# Altium schematic sheet MONO65_A2_s02 [Block diagram].SchDoc
size A3; DocumentNumber: 2; SheetNumber: 2; SheetTotal: 7
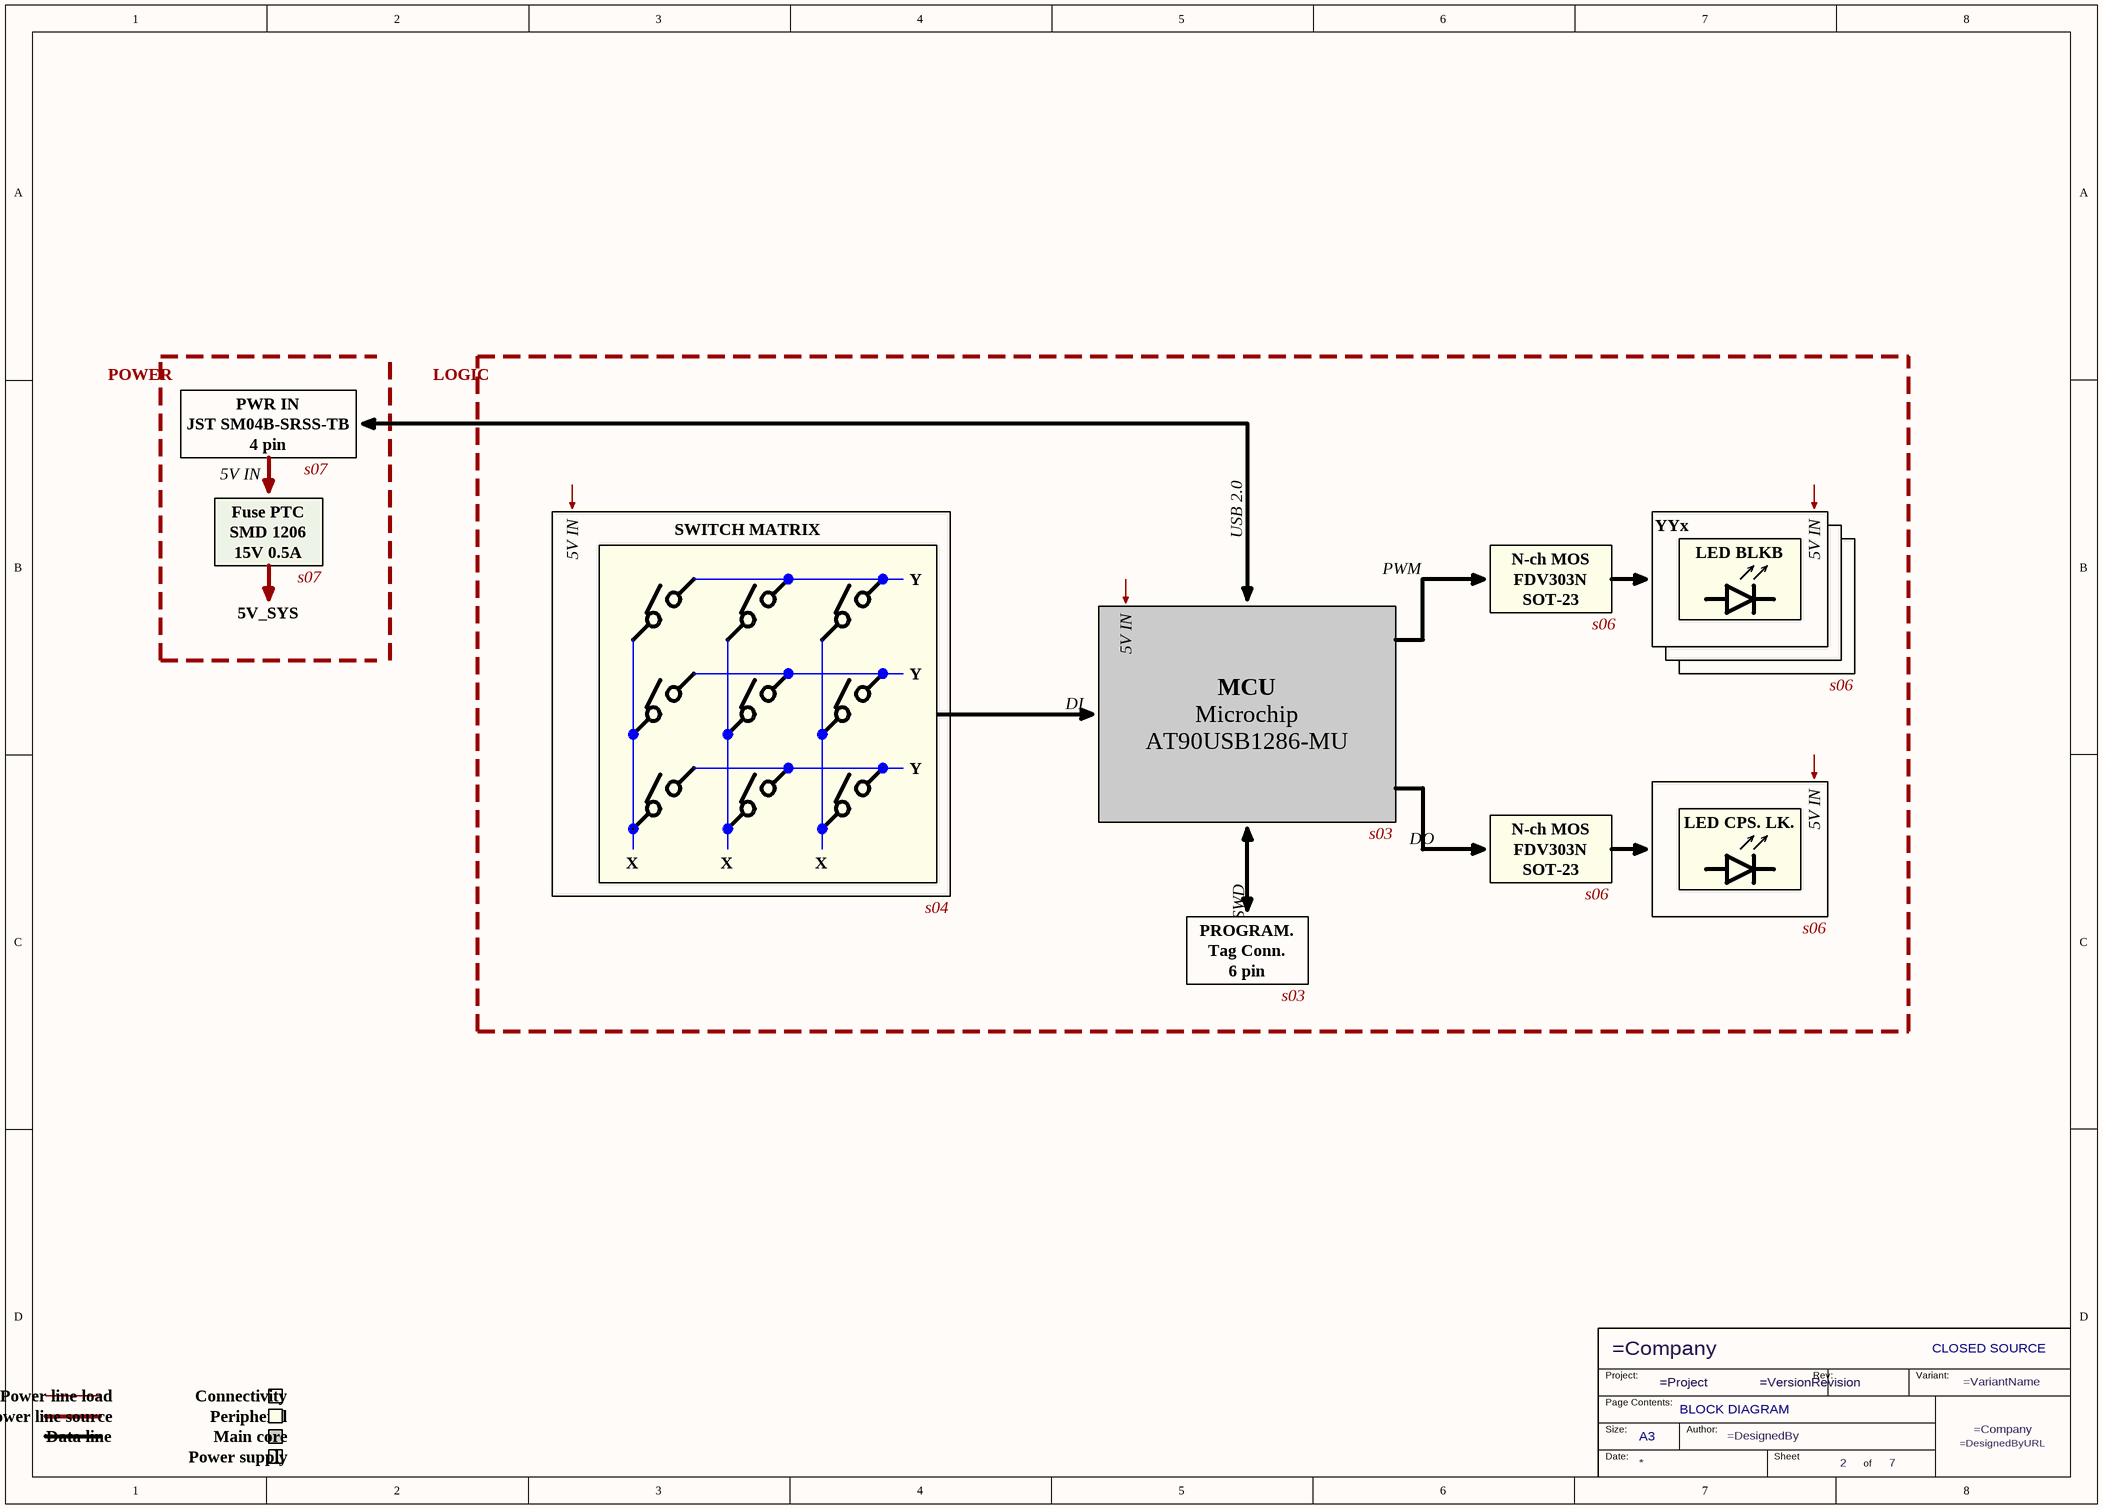
[diagram p0: MONO65_A2_s02 [Block diagram].SchDoc]

## Parts
TB*?  PageContents: BLOCK DIAGRAM  Licence: CLOSED SOURCE  Size: A3  (hidden comment: TBL TitleBlock 01)  (graphical)

## Notes on the sheet
- POWER
- LOGIC
- 4 pin
- JST SM04B-SRSS-TB
- PWR IN
- s07
- 5V IN
- Fuse PTC
- SWITCH MATRIX
- SMD 1206
- 15V 0.5A
- Y
- USB 2.0
- PWM
- FDV303N
- N-ch MOS
- YYx
- LED BLKB
- 5V_SYS
- SOT-23
- s06
- DI
- MCU
- Microchip
- AT90USB1286-MU
- X
- s03
- DO
- LED CPS. LK.
- s04
- SWD
- 6 pin
- Tag Conn.
- PROGRAM.
- Power line load
- Connectivity
- Data line
- Power line source
- Peripheral
- Main core
- Power supply
- (in symbol TBL TitleBlock 01) Project:; Rev:; Variant:; Page Contents:; Size:; Author:; Date:; Sheet; of

## Library data of the parts
TB*? = TBL TitleBlock 01: Custom Title block